# Altium project Main-PCB-v1.0.PrjPcb (part 2 of 3)

## Sheet Power-Sheet.SchDoc
size 420 x 297 mm; SheetNumber: 2; SheetTotal: 4
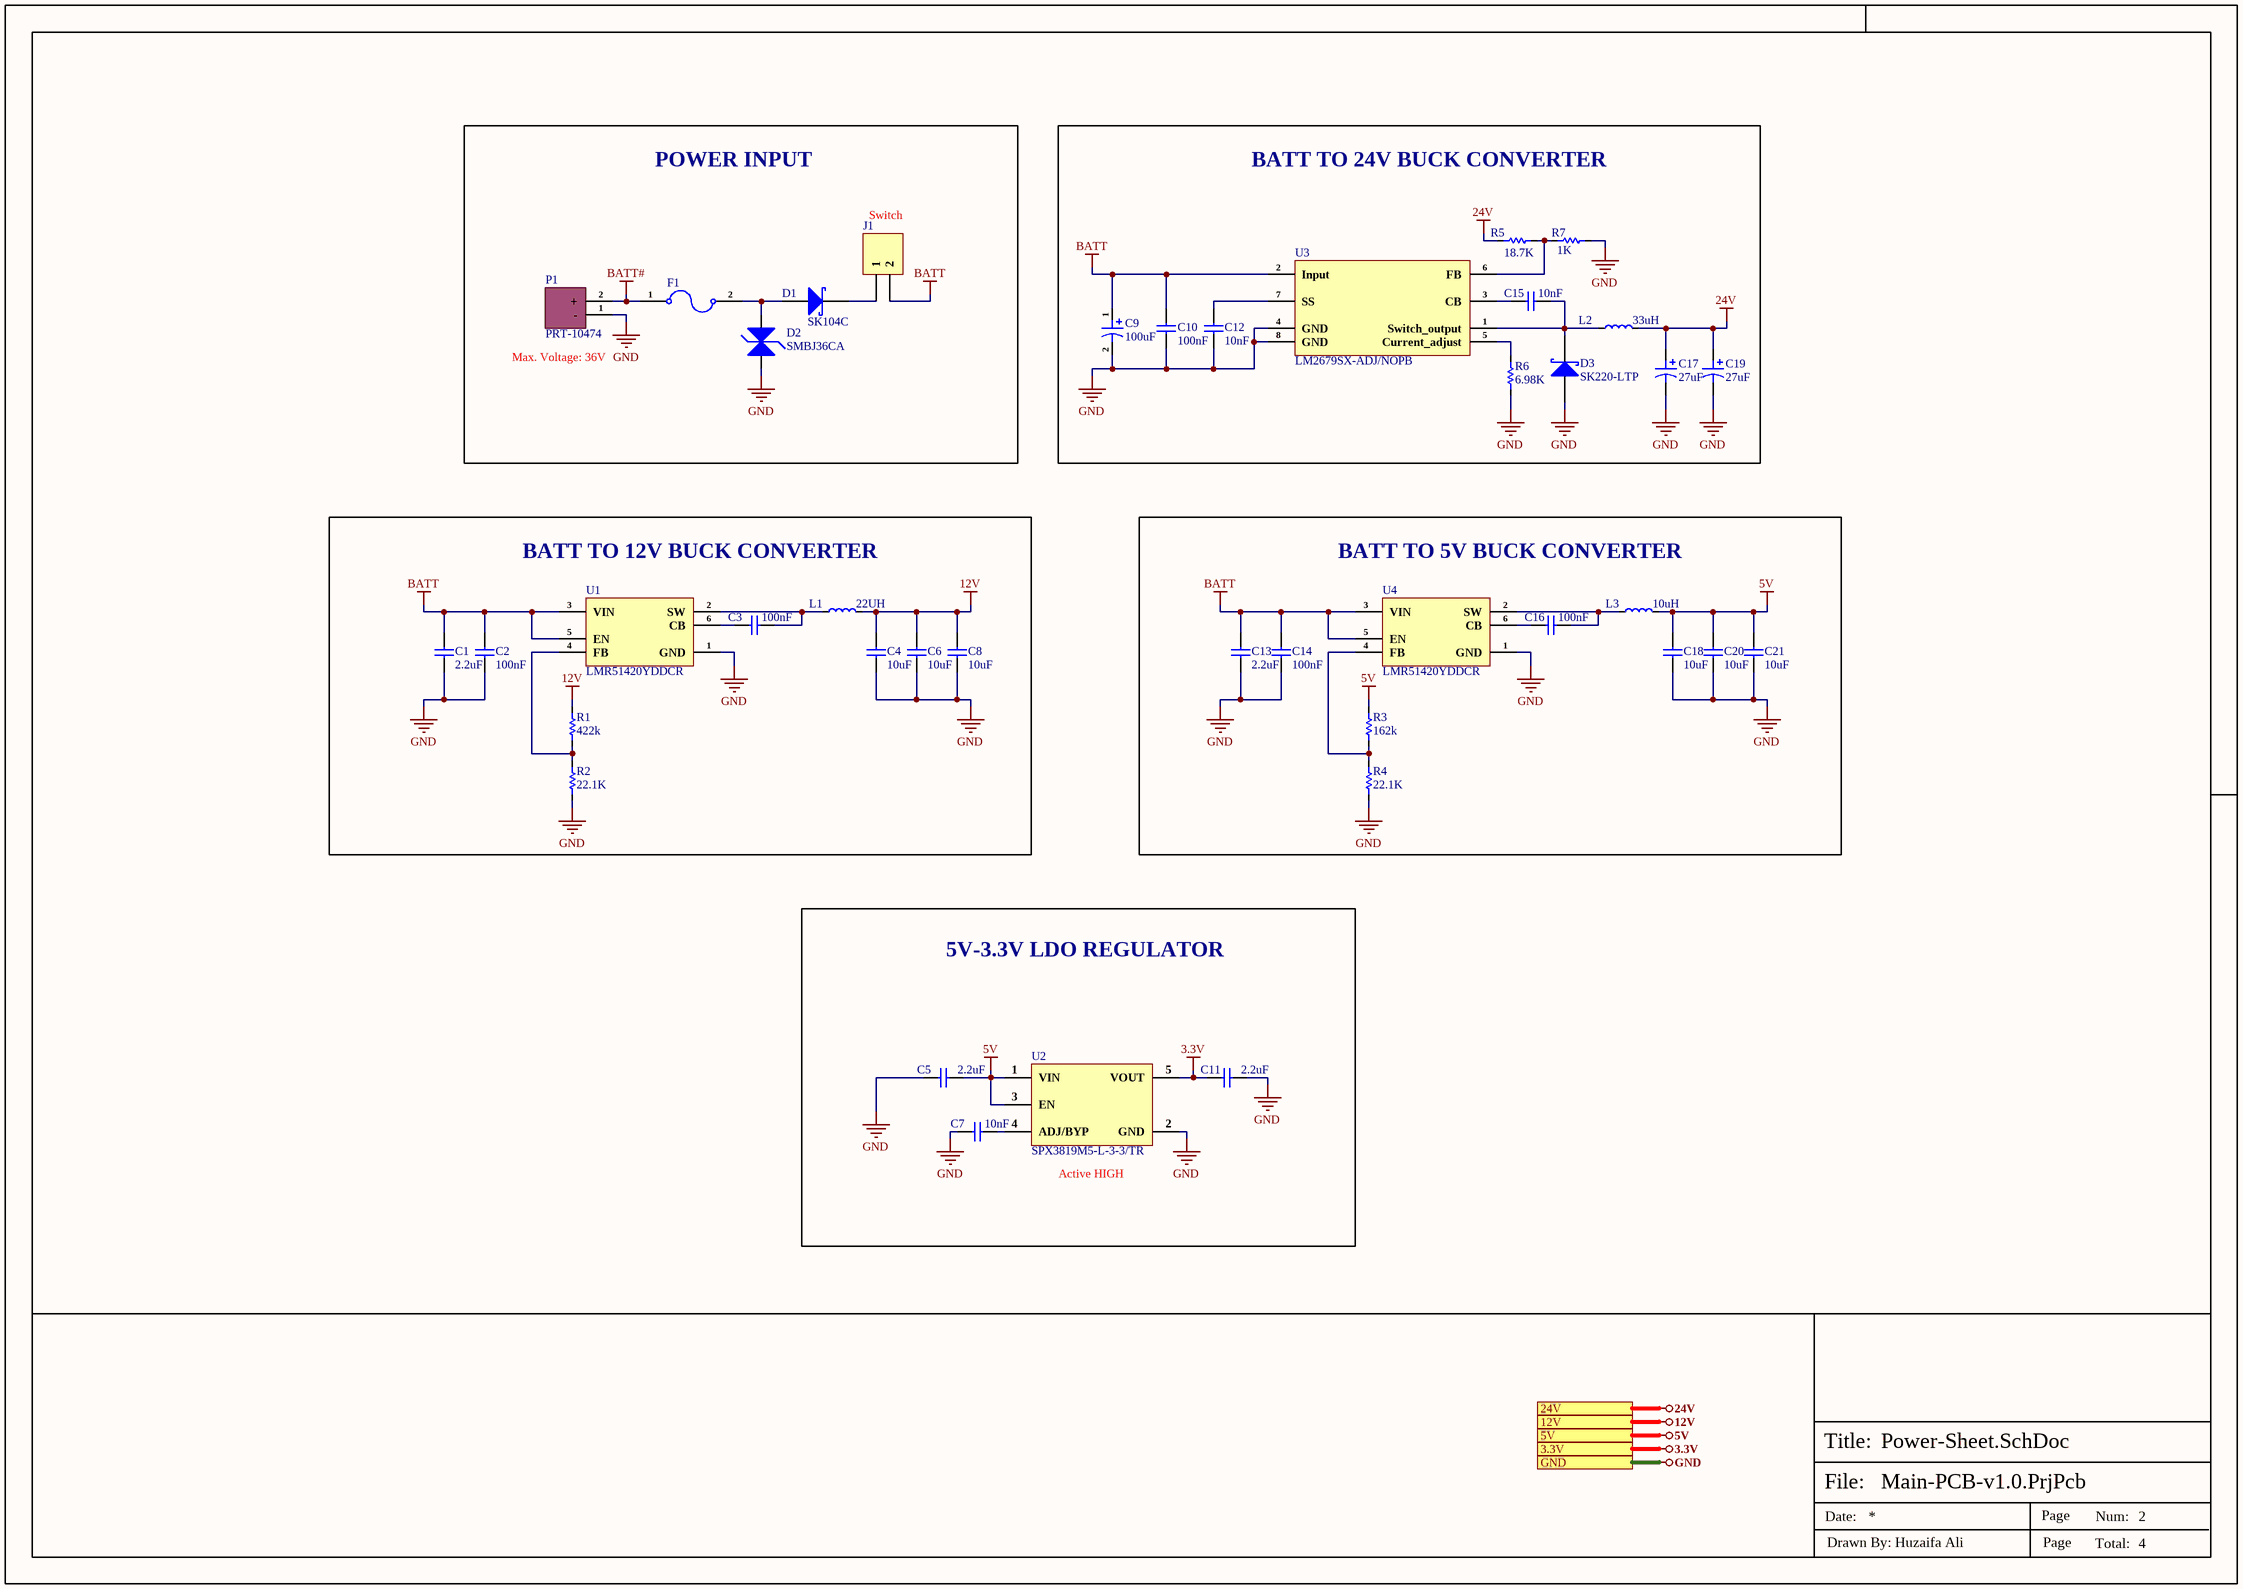
[diagram p2: Power-Sheet.SchDoc]

### Parts
C1  2.2uF  [Cap-0805]
C2  100nF  [Cap-0603]
C3  100nF  [Cap-0603]
C4  10uF  [Cap-0603]
C5  2.2uF  [CAP-0603]
C6  10uF  [Cap-0603]
C7  10nF  [Cap-0603]
C8  10uF  [Cap-0603]
C9  100uF  [UUD-100uF-8mmDia]
C10  100nF  [Cap-0603]
C11  2.2uF  [CAP-0603]
C12  10nF  [Cap-0402]
C13  2.2uF  [Cap-0805]
C14  100nF  [Cap-0603]
C15  10nF  [Cap-0402]
C16  100nF  [Cap-0603]
C17  27uF  [VUA270M1VTR-0606]
C18  10uF  [Cap-0603]
C19  27uF  [VUA270M1VTR-0606]
C20  10uF  [Cap-0603]
C21  10uF  [Cap-0603]
D1  SK104C  [SMC]
D2  SMBJ36CA  [SMB_]
D3  SK220-LTP  [SMB_]
F1  SHV2920P500-30-AA  [Fuse-2920]  (value not drawn)
J1  2P THrough Hole Pads  [2P THrough Hole Pads]  (value not drawn)
L1  22UH  [YPRH1204-220M_]
L2  33uH  [YPRH1508-330M]
L3  10uH  [SWPA8040S100MT]
P1  PRT-10474  [PRT-10474]
R1  422k  [RES-0805]
R2  22.1K  [Res-0402]
R3  162k  [Res-0402]
R4  22.1K  [Res-0402]
R5  18.7K  [Res-0402]
R6  6.98K  [Res-0402]
R7  1K  [Res-0402]
U1  LMR51420YDDCR  [SOT-23-6 THIN]
U2  SPX3819M5-L-3-3/TR  [SOT-23-5]
U3  LM2679SX-ADJ/NOPB  [TO-263-7]
U4  LMR51420YDDCR  [SOT-23-6 THIN]

### Blocks framed on the sheet
POWER INPUT: D1 D2 F1 J1 P1
BATT TO 24V BUCK CONVERTER: C9 C10 C12 C15 C17 C19 D3 L2 R5-R7 U3
BATT TO 12V BUCK CONVERTER: C1-C4 C6 C8 L1 R1 R2 U1
BATT TO 5V BUCK CONVERTER: C13 C14 C16 C18 C20 C21 L3 R3 R4 U4
5V-3.3V LDO REGULATOR: C5 C7 C11 U2

### Ports
3.3V, 5V, 12V, 24V, GND

### Nets
3.3V: C11.1 U2.5(VOUT) ; port 3.3V
5V: C5.2 C18.2 C20.2 C21.2 L3.2 R3.2 U2.1(VIN) U2.3(EN) ; port 5V
12V: C4.2 C6.2 C8.2 L1.2 R1.2 ; port 12V
24V: C17.1 C19.1 L2.2 R5.1 ; port 24V
BATT: C1.2 C2.2 C9.1 C10.2 C13.2 C14.2 J1.2 U1.3(VIN) U1.5(EN) U3.2(Input) U4.3(VIN) U4.5(EN)
BATT#: F1.1 P1.2(+)
GND: C1.1 C2.1 C4.1 C5.1 C6.1 C7.1 C8.1 C9.2 C10.1 C11.2 C12.1 C13.1 C14.1 C17.2 C18.1 C19.2 C20.1 C21.1 D2.1(A) D3.1 P1.1(-) R2.1 R4.1 R6.1 R7.1 U1.1(GND) U2.2(GND) U3.4(GND) U3.8(GND) U4.1(GND) ; port GND
NetC3_1: C3.1 L1.1 U1.2(SW)
NetC3_2: C3.2 U1.6(CB)
NetC7_2: C7.2 U2.4(ADJ/BYP)
NetC12_2: C12.2 U3.7(SS)
NetC15_1: C15.1 D3.2 L2.1 U3.1(Switch_output)
NetC15_2: C15.2 U3.3(CB)
NetC16_1: C16.1 L3.1 U4.2(SW)
NetC16_2: C16.2 U4.6(CB)
NetD1_1: D1.1 J1.1
NetD1_2: D1.2 D2.2(A) F1.2
NetR1_1: R1.1 R2.2 U1.4(FB)
NetR3_1: R3.1 R4.2 U4.4(FB)
NetR5_2: R5.2 R7.2 U3.6(FB)
NetR6_2: R6.2 U3.5(Current_adjust)

### Notes on the sheet
- Switch
- (near P1) Max. Voltage: 36V
- (near U2) Active HIGH
- File:
- Title:
- Date:
- Page
- Num:
- Total:
- Drawn By: Huzaifa Ali

### Library data of the parts
C1 C13 = CC0805KKX5R9BB225: CAP CER 2.2UF 50V X5R 0805; Manufacturer: Yageo; Tolerance: 10%; Item Type: Capacitor; Supplier 1: Mouser; Manufacturer Part Number: CC0805KKX5R9BB225; RoHS: Yes; Category: Ceramic Capacitors; Stock 1: 3880; Pricing 1: 1=0.26000, 10=0.12100, 50=0.12100, 100=0.08700, 1000=0.06700, 10000=0.05000 (USD); Mounting Technology: Surface Mount; Case/Package: 0805; Case Code (Metric): 2012; Case Code (Imperial): 0805; Weight: 0.000194oz; Min Operating Temperature: -55°C; Max Operating Temperature: 85°C; Packaging: Tape and Reel; Value: 2.2uF; Voltage Rating: 50V; Dielectric: X5R; Termination: SMD/SMT; Resistor Type: Ceramic; Voltage Rating (DC): 50V; Package Quantity: 3000; Length: 0.079inch; Width: 1.25mm; Thickness: 0.057inch; Lead Free: Lead Free; Halogen Free: Halogen Free; RoHS Compliant: Yes; ComponentLink1URL: http://www.mouser.com/ds/2/447/Yageo_UPY-GP_NP0_16V-to-50V_9-358835.pdf?src-supplier=Mouser; ComponentLink1Description: http://www.mouser.com/ds/2/447/Yageo_UPY-GP_NP0_16V-to-50V_9-358835.pdf?src-supplier=Mouser; ComponentLink2URL: http://www.yageo.com/documents/recent/UPY-GPHC_X5R_4V-to-50V_25.pdf?src-supplier=Digi-Key; ComponentLink2Description: http://www.yageo.com/documents/recent/UPY-GPHC_X5R_4V-to-50V_25.pdf?src-supplier=Digi-Key; Supplier Part Number 1: 603-CC805KKX5R9BB225; LCSC Part Number: C326581
C2 C3 C10 C14 C16 = CC0603KRX5R9BB104: CAP CER 0.1UF 50V X5R 0603; Manufacturer: Yageo; Tolerance: 10%; Item Type: Capacitor; Supplier 1: Digi-Key; Manufacturer Part Number: CC0603KRX5R9BB104; RoHS: Yes; Category: Ceramic Capacitors; Stock 1: 152253; Pricing 1: 1=0.10000, 10=0.05200, 50=0.02820, 100=0.02310, 500=0.01648, 1000=0.01294 (USD); Mount: Surface Mount; Case/Package: 0603; Case Code (Imperial): 0603; Case Code (Metric): 1608; Weight: 7.1E-05oz; Min Operating Temperature: -55°C; Max Operating Temperature: 85°C; Capacitance: 100nF; Packaging: Tape and Reel; Voltage Rating: 50V; Dielectric: X5R; Termination: SMD/SMT; Voltage Rating (DC): 50V; Package Quantity: 4000; Length: 0.063inch; Width: 0.031inch; Thickness: 0.035inch; Lead Free: Lead Free; Halogen Free: Halogen Free; ComponentLink1URL: http://www.mouser.com/ds/2/447/Yageo_UPY-GP_NP0_16V-to-50V_9-358835.pdf?src-supplier=Mouser; ComponentLink1Description: http://www.mouser.com/ds/2/447/Yageo_UPY-GP_NP0_16V-to-50V_9-358835.pdf?src-supplier=Mouser; ComponentLink2URL: https://www.yageo.com/upload/media/product/productsearch/datasheet/mlcc/UPY-GPHC_X5R_4V-to-50V_26.pdf?src-supplier=Digi-Key; ComponentLink2Description: https://www.yageo.com/upload/media/product/productsearch/datasheet/mlcc/UPY-GPHC_X5R_4V-to-50V_26.pdf?src-supplier=Digi-Key; ComponentLink3URL: http://www.yageo.com/exep/pages/download/literatures/ProductSelectionGuide%202014_Final_2.pdf?src-supplier=Digi-Key; ComponentLink3Description: http://www.yageo.com/exep/pages/download/literatures/ProductSelectionGuide%202014_Final_2.pdf?src-supplier=Digi-Key; Supplier Part Number 1: 311-4046-1-ND; LCSC Part Number: C110022
C4 C6 C8 C18 C20 C21 = CC0603KRX5R6BB106: CAP CER 10UF 10V X5R 0603; Manufacturer: Yageo; Tolerance: 10%; Item Type: Capacitor; Supplier 1: Digi-Key; Manufacturer Part Number: CC0603KRX5R6BB106; RoHS: Yes; Category: Ceramic Capacitors; Stock 1: 187515; Pricing 1: 1=0.24000, 10=0.16300, 50=0.09780, 100=0.08260, 500=0.05654, 1000=0.05001 (USD); Mount: Surface Mount; Case/Package: 0603; Case Code (Metric): 1608; Case Code (Imperial): 0603; Weight: 7.1E-05oz; Min Operating Temperature: -55°C; Max Operating Temperature: 85°C; Capacitance: 10uF; Packaging: Tape and Reel; Dielectric: X5R; Voltage Rating: 10V; Termination: SMD/SMT; Resistor Type: Ceramic; Voltage Rating (DC): 10V; Package Quantity: 4000; Length: 0.063inch; Width: 0.031inch; Thickness: 0.035inch; Depth: 0.8mm; Lead Free: Lead Free; Halogen Free: Halogen Free; RoHS Compliant: Yes; ComponentLink1URL: http://www.mouser.com/ds/2/447/Yageo_UPY-GP_NP0_16V-to-50V_9-358835.pdf?src-supplier=Mouser; ComponentLink1Description: http://www.mouser.com/ds/2/447/Yageo_UPY-GP_NP0_16V-to-50V_9-358835.pdf?src-supplier=Mouser; ComponentLink2URL: http://www.yageo.com/documents/recent/UPY-GPHC_X5R_4V-to-50V_25.pdf?src-supplier=Digi-Key; ComponentLink2Description: http://www.yageo.com/documents/recent/UPY-GPHC_X5R_4V-to-50V_25.pdf?src-supplier=Digi-Key; Supplier Part Number 1: 311-1782-1-ND; LCSC Part Number: C326057
C5 C11 = CC0603KRX5R8BB225: CAP CER 2.2UF 25V X5R 0603; Manufacturer: Yageo; Tolerance: 10%; Supplier 1: Digi-Key; Manufacturer Part Number: CC0603KRX5R8BB225; Stock 1: 687936; Pricing 1: 1=0.4, 10=0.276, 50=0.1932, 100=0.1656, 500=0.1242, 1000=0.10488 (USD); Mount: Surface Mount; Case/Package: 0603; Case Code (Metric): 1608; Case Code (Imperial): 0603; Weight: 7.1E-05oz; Min Operating Temperature: -55°C; Max Operating Temperature: 85°C; Packaging: Tape and Reel; Capacitance: 2.2uF; Dielectric: X5R; Voltage Rating: 25V; Termination: SMD/SMT; Resistor Type: Ceramic; Voltage Rating (DC): 25V; Package Quantity: 4000; Length: 1.6mm; Width: 0.031inch; Thickness: 0.037inch; Depth: 0.8mm; Radiation Hardening: No; Lead Free: Lead Free; Halogen Free: Halogen Free; RoHS Compliant: Yes; ComponentLink1URL: https://www.verical.com/server-webapp/html/getDatasheet?partID=782757&src-supplier=Verical; ComponentLink1Description: https://www.verical.com/server-webapp/html/getDatasheet?partID=782757&src-supplier=Verical; Supplier Part Number 1: 311-1786-1-ND; LCSC Part Number: C309478
C7 = CC0603JRNPO9BN103: CAP CER 10000PF 50V C0G/NPO 0603; Manufacturer: Yageo; Tolerance: 5%; Item Type: Capacitor; Supplier 1: Arrow Electronics; Manufacturer Part Number: CC0603JRNPO9BN103; RoHS: Yes; Category: Ceramic Capacitors; Stock 1: 5425; Pricing 1: 1=0.42340, 10=0.29770, 25=0.25590, 100=0.19550, 250=0.19360, 500=0.14320, 1000=0.12060, 3000=0.11930 (USD); Mount: Surface Mount; Case/Package: 0603; Min Operating Temperature: -55°C; Max Operating Temperature: 125°C; Packaging: Tape and Reel; Capacitance: 10nF; Voltage Rating: 50V; Length: 0.063inch; Width: 0.031inch; Thickness: 0.035inch; RoHS Compliant: Yes; ComponentLink1URL: http://www.yageo.com/documents/recent/UPY-GP_NP0_16V-to-50V_16.pdf?src-supplier=Digi-Key; ComponentLink1Description: http://www.yageo.com/documents/recent/UPY-GP_NP0_16V-to-50V_16.pdf?src-supplier=Digi-Key; ComponentLink2URL: http://www.yageo.com/exep/pages/download/literatures/ProductSelectionGuide%202014_Final_2.pdf?src-supplier=Digi-Key; ComponentLink2Description: http://www.yageo.com/exep/pages/download/literatures/ProductSelectionGuide%202014_Final_2.pdf?src-supplier=Digi-Key; Supplier Part Number 1: CC0603JRNPO9BN103; LCSC Part Number: C389113
C9 = UUD1H101MNL1GS: CAP ALUM 100UF 20% 50V SMD; Manufacturer: Nichicon; Dielectric Material: Aluminium; Ripple Current: 300mA; Life (Hours): 5000Hour; Impedance: 340mR; Leakage Current: 3uA; Dissipation Factor: 0.14%; Lead Diameter: 1.1mm; Item Type: Capacitor; Supplier 1: Digi-Key; Manufacturer Part Number: UUD1H101MNL1GS; RoHS: Yes; Category: Aluminum Electrolytic Capacitors; Pricing 1: 1=0.62000, 10=0.44000, 50=0.33300, 100=0.29000 (USD); Case/Package: Radial; Number of Pins: 2; Min Operating Temperature: -55°C; Max Operating Temperature: 105°C; Tolerance: 20%; Capacitance: 100uF; Ripple Current (AC): 300mA; Voltage Rating (DC): 50V; Package Quantity: 500; Packaging: Tape and Reel; Voltage Rating: 50V; Termination: SMD/SMT; Voltage: 50V; Series: UD; Construction: Cylindrical; Diameter: 8mm; Length: 10mm; Height: 10mm; Lead Pitch: 3.1mm; Height - Seated (Max): 0.394inch; Radiation Hardening: No; REACH SVHC: No SVHC; Lead Free: Lead Free; RoHS Compliant: Yes; ComponentLink1URL: https://datasheet.ciiva.com/6002/66055-6002224.pdf?src-supplier=Farnell; ComponentLink1Description: https://datasheet.ciiva.com/6002/66055-6002224.pdf?src-supplier=Farnell; ComponentLink2URL: https://datasheet.ciiva.com/11781/0900766b80fa39e7-11781901.pdf?src-supplier=RSComponents; ComponentLink2Description: https://datasheet.ciiva.com/11781/0900766b80fa39e7-11781901.pdf?src-supplier=RSComponents; ComponentLink3URL: https://datasheet.ciiva.com/97/e-ud-97939.pdf?src-supplier=Digi-Key; ComponentLink3Description: https://datasheet.ciiva.com/97/e-ud-97939.pdf?src-supplier=Digi-Key; ComponentLink4URL: https://datasheet.ciiva.com/97/e-ud-97940.pdf?src-supplier=Digi-Key; ComponentLink4Description: https://datasheet.ciiva.com/97/e-ud-97940.pdf?src-supplier=Digi-Key; ComponentLink5URL: https://datasheet.ciiva.com/97/e-ud-97941.pdf?src-supplier=Digi-Key; ComponentLink5Description: https://datasheet.ciiva.com/97/e-ud-97941.pdf?src-supplier=Digi-Key; ComponentLink6URL: https://datasheet.ciiva.com/28458/e-ud-28458117.pdf?src-supplier=Element14; ComponentLink6Description: https://datasheet.ciiva.com/28458/e-ud-28458117.pdf?src-supplier=Element14; ComponentLink7URL: https://datasheet.ciiva.com/28458/1910936-28458133.pdf?src-supplier=Element14; ComponentLink7Description: https://datasheet.ciiva.com/28458/1910936-28458133.pdf?src-supplier=Element14; ComponentLink8URL: https://datasheet.ciiva.com/5362/e-ud-5362134.pdf?src-supplier=Mouser; ComponentLink8Description: https://datasheet.ciiva.com/5362/e-ud-5362134.pdf?src-supplier=Mouser; ComponentLink9URL: https://datasheet.ciiva.com/7781/66055-7781450.pdf?src-supplier=Element14; ComponentLink9Description: https://datasheet.ciiva.com/7781/66055-7781450.pdf?src-supplier=Element14; ComponentLink10URL: https://datasheet.ciiva.com/17354/e-ud-17354671.pdf?src-supplier=Avnet+Europe; ComponentLink10Description: https://datasheet.ciiva.com/17354/e-ud-17354671.pdf?src-supplier=Avnet+Europe; Supplier Part Number 1: 493-2306-6-ND; LCSC Part Number: C116241
C12 C15 = CC0402KRX7R9BB103: CAP CER 10000PF 50V X7R 0402; Manufacturer: Yageo; Tolerance: 10%; Item Type: Capacitor; Supplier 1: Avnet; Manufacturer Part Number: CC0402KRX7R9BB103; RoHS: Yes; Category: Ceramic Capacitors; Stock 1: 995000; Pricing 1: 10000=0.00178 (USD); Mount: Surface Mount; Case/Package: 0402; Case Code (Imperial): 0402; Case Code (Metric): 1005; Min Operating Temperature: -55°C; Max Operating Temperature: 125°C; Capacitance: 10nF; Dielectric: X7R; Packaging: Tape and Reel; Voltage Rating: 50V; Voltage Rating (DC): 50V; Package Quantity: 1; Termination: SMD/SMT; Resistor Type: Ceramic; Voltage: 50V; Series: CC; Length: 1mm; Width: 0.02inch; Height: 0.5mm; Thickness: 0.022inch; Depth: 0.5mm; Radiation Hardening: No; RoHS Compliant: Yes; Reach SVHC Compliant: Yes; Lead Free: Lead Free; Halogen Free: Halogen Free; ComponentLink1URL: https://datasheet.ciiva.com/11788/0900766b8079c870-11788375.pdf?src-supplier=RSComponents; ComponentLink1Description: https://datasheet.ciiva.com/11788/0900766b8079c870-11788375.pdf?src-supplier=RSComponents; ComponentLink2URL: https://datasheet.ciiva.com/26862/getdatasheetpartid-138248-26862642.pdf?src-supplier=Verical; ComponentLink2Description: https://datasheet.ciiva.com/26862/getdatasheetpartid-138248-26862642.pdf?src-supplier=Verical; ComponentLink3URL: https://datasheet.ciiva.com/7978/1489800-7978093.pdf?src-supplier=Element14; ComponentLink3Description: https://datasheet.ciiva.com/7978/1489800-7978093.pdf?src-supplier=Element14; ComponentLink4URL: https://datasheet.ciiva.com/28450/1489800-28450377.pdf?src-supplier=Element14; ComponentLink4Description: https://datasheet.ciiva.com/28450/1489800-28450377.pdf?src-supplier=Element14; ComponentLink5URL: https://datasheet.ciiva.com/176/mlccorderingcode-176349.pdf?src-supplier=Digi-Key; ComponentLink5Description: https://datasheet.ciiva.com/176/mlccorderingcode-176349.pdf?src-supplier=Digi-Key; ComponentLink6URL: https://datasheet.ciiva.com/176/mlccorderingcode-176348.pdf?src-supplier=Digi-Key; ComponentLink6Description: https://datasheet.ciiva.com/176/mlccorderingcode-176348.pdf?src-supplier=Digi-Key; ComponentLink7URL: https://datasheet.ciiva.com/176/mlccorderingcode-176350.pdf?src-supplier=Digi-Key; ComponentLink7Description: https://datasheet.ciiva.com/176/mlccorderingcode-176350.pdf?src-supplier=Digi-Key; Supplier Part Number 1: CC0402KRX7R9BB103; LCSC Part Number: C60133
C17 C19 = VUA270M1VTR-0606: 27uF 35V ±20% SMD,D6.3xL5.7mm Aluminum Electrolytic Capacitors - SMD ROHS; Manufacturer: Lelon; Manufacturer Part Number: VUA270M1VTR-0606; Package: SMD,D6.3xL5.7mm; LCSC Part Number: C249807; Item Type: Capacitor; ComponentLink1Description: LCSC; ComponentLink1URL: https://www.lcsc.com/product-detail/Aluminum-Electrolytic-Capacitors-SMD_Lelon-VUA270M1VTR-0606_C249807.html
D1 = SK104C: 40V 650mV@10A 10A SMC(DO-214AB) Schottky Barrier Diodes (SBD) ROHS; Manufacturer: MDD; Item Type: Diode; Manufacturer Part Number: SK104C; Package: SMC(DO-214AB); LCSC Part Number: C59500; ComponentLink1Description: LCSC; ComponentLink1URL: https://www.lcsc.com/product-detail/Schottky-Barrier-Diodes-SBD_MDD-Microdiode-Electronics-SK104C_C59500.html
D2 = SMBJ36CA: 58.1V 40V 36V Bi-Directional SMB(DO-214AA) TVS ROHS; Manufacturer: Slkor(SLKORMICRO Elec.); Item Type: Diode; Manufacturer Part Number: SMBJ36CA; Package: SMB(DO-214AA); LCSC Part Number: C556189; ComponentLink1Description: LCSC; ComponentLink1URL: https://www.lcsc.com/product-detail/span-style-background-color-ff0-TVS-span_Slkor-SLKORMICRO-Elec-SMBJ36CA_C556189.html
D3 = SK220-LTP: 200V 900mV@2A 2A SMB(DO-214AA) Schottky Barrier Diodes (SBD) ROHS; Manufacturer: MCC; Item Type: Diode; Supplier 1: Mouser; Manufacturer Part Number: SK220-LTP; RoHS: Yes; Category: Rectifier Diodes; Stock 1: 5871; Pricing 1: 1=0.47, 10=0.364, 50=0.364, 100=0.227, 1000=0.12, 10000=0.092 (USD); Mounting Technology: Surface Mount; Package Quantity: 3000; Packaging: Tape and Reel; Average Rectified Current: 2A; Max Reverse Voltage (DC): 200V; Series: -; Lead Free: Lead Free; RoHS Compliant: Yes; ComponentLink1URL: https://datasheet.ciiva.com/6377/sk22-lsk220-ldo-214aa-6377942.pdf?src-supplier=Digi-Key; ComponentLink1Description: https://datasheet.ciiva.com/6377/sk22-lsk220-ldo-214aa-6377942.pdf?src-supplier=Digi-Key; Supplier Part Number 1: 833-SK220-LTP; LCSC Part Number: C725397
F1 = SHV2920P500-30-AA: 30V 5A 5A 2920 Resettable Fuses ROHS; Manufacturer: PTTC(Polytronics Tech); Item Type: Fuse; ComponentLink1Description: LCSC; ComponentLink1URL: https://www.lcsc.com/product-detail/Resettable-Fuses_PTTC-Polytronics-Tech-SHV2920P500-30-AA_C495350.html; Manufacturer Part Number: SHV2920P500-30-AA; Package: 2920; LCSC Part Number: C495350
J1 = 2P THrough Hole Pads: Wire Connecting Pad; Manufacturer Part Number: 2P THrough Hole Pads; Item Type: THrough Hole Pads
L1 = YPRH1204-220M: 2.9A 22uH ±20% 66mΩ SMD,12x12x5mm Power Inductors ROHS; Manufacturer: YJYCOIN; Manufacturer Part Number: YPRH1204-220M; Package: SMD,12x12x5mm; LCSC Part Number: C338845; Item Type: Inductor; ComponentLink1Description: LCSC; ComponentLink1URL: https://www.lcsc.com/product-detail/Power-Inductors_YJYCOIN-YPRH1204-220M_C338845.html
L2 = YPRH1508-330M: 6A 33uH ±20% SMD,15x15x8mm Power Inductors ROHS; Manufacturer: YJYCOIN; ComponentLink1Description: LCSC; ComponentLink1URL: https://www.lcsc.com/product-detail/Power-Inductors_YJYCOIN-YPRH1508-330M_C970542.html; Manufacturer Part Number: YPRH1508-330M; Package: SMD,15x15x8mm; LCSC Part Number: C970542; Item Type: Inductor
L3 = SWPA8040S100MT: Fixed Ind 1020%UH 0.029 Ohm 4100M; Manufacturer: Sunlord; Item Type: Inductor; Supplier 1: Digi-Key; Manufacturer Part Number: SWPA8040S100MT; RoHS: Yes; Category: Fixed Inductors; Stock 1: 2032; Pricing 1: 1=1.24, 10=1.149, 25=1.0604, 50=0.8838, 100=0.8307, 250=0.74236, 500=0.6363 (USD); RoHS Compliant: Yes; Supplier Part Number 1: 3442-SWPA8040S100MTCT-ND; LCSC Part Number: C37429; ComponentLink1Description: LCSC; ComponentLink1URL: https://www.lcsc.com/product-detail/Power-Inductors_Sunlord-SWPA8040S100MT_C37429.html
P1 = PRT-10474: XT60 CONNECTORS MALE/FEMALE PAIR; Manufacturer: SparkFun; Supplier 1: Digi-Key; Manufacturer Part Number: PRT-10474; RoHS: No; Stock 1: 3234; Pricing 1: 1=1.50000 (USD); ComponentLink1URL: https://cdn.sparkfun.com/datasheets/Prototyping/xt60.pdf?src-supplier=Digi-Key; ComponentLink1Description: https://cdn.sparkfun.com/datasheets/Prototyping/xt60.pdf?src-supplier=Digi-Key; Supplier Part Number 1: 1568-1816-ND
R1 = RT0805BRD07422KL: RES SMD 422K OHM 0.1% 1/8W 0805; Manufacturer: Yageo; Voltage Rating: 150V; Value: 422kR; Power Rating: 125mW; Temperature Coefficient: 25ppm/°C; Item Type: Resistor; Supplier 1: Digi-Key; Manufacturer Part Number: RT0805BRD07422KL; RoHS: Yes; Category: Chip SMD Resistors; Stock 1: 2917; Pricing 1: 1=0.38, 10=0.272, 100=0.1087, 500=0.07404, 1000=0.05357, 2500=0.04963 (USD); Case/Package: 0805; Case Code (Metric): 2012; Case Code (Imperial): 0805; Min Operating Temperature: -55°C; Max Operating Temperature: 155°C; Tolerance: 0.1%; Packaging: Tape and Reel; Termination: SMD/SMT; Voltage Rating (DC): 150V; Series: RT; Max Power Dissipation: 125mW; Number of Terminations: 2; Length: 2mm; Width: 1.25mm; Height: 500um; Lead Free: Lead Free; RoHS Compliant: Yes; ComponentLink1URL: https://datasheet.ciiva.com/12704/pyu-rt-1-to-0-05-rohs-l-4-12704463.pdf?src-supplier=Mouser; ComponentLink1Description: https://datasheet.ciiva.com/12704/pyu-rt-1-to-0-05-rohs-l-4-12704463.pdf?src-supplier=Mouser; Supplier Part Number 1: YAG4899CT-ND; LCSC Part Number: C865483
R2 R4 = RT0402BRD0722K1L: RES SMD 22.1KOHM 0.1% 1/16W 0402; Manufacturer: Yageo; Value: 22.1kR; Power Rating: 62.5mW; Voltage Rating: 50V; Max Power Dissipation: 63mW; Temperature Coefficient: 25ppm/°C; Item Type: Resistor; Supplier 1: Arrow Electronics; Manufacturer Part Number: RT0402BRD0722K1L; RoHS: Yes; Category: Chip SMD Resistors; Stock 1: 40000; Pricing 1: 10000=0.0417, 20000=0.0733, 30000=0.041, 40000=0.0719, 50000=0.0402, 100000=0.0393 (USD); Case/Package: 0402; Case Code (Metric): 1005; Case Code (Imperial): 0402; Weight: 2.3E-05oz; Min Operating Temperature: -55°C; Max Operating Temperature: 155°C; Tolerance: 0.1%; Packaging: Tape and Reel; Package Quantity: 10000; Number of Terminations: 2; Termination: SMD/SMT; Voltage Rating (DC): 50V; Series: RT; Length: 0.039inch; Width: 0.5mm; Height: 0.014inch; Lead Free: Lead Free; RoHS Compliant: Yes; ComponentLink1URL: https://datasheet.ciiva.com/2582/pyu-rt-1-to-0-05-rohs-l-5-2582235.pdf?src-supplier=Digi-Key; ComponentLink1Description: https://datasheet.ciiva.com/2582/pyu-rt-1-to-0-05-rohs-l-5-2582235.pdf?src-supplier=Digi-Key; ComponentLink2URL: https://datasheet.ciiva.com/12797/pyu-rt-1-to-0-05-rohs-l-4-12797086.pdf?src-supplier=Mouser; ComponentLink2Description: https://datasheet.ciiva.com/12797/pyu-rt-1-to-0-05-rohs-l-4-12797086.pdf?src-supplier=Mouser; Supplier Part Number 1: RT0402BRD0722K1L; LCSC Part Number: C852648
R3 = RT0402BRD07162KL: RES SMD 162K OHM 0.1% 1/16W 0402; Manufacturer: Yageo; Value: 162kR; Max Power Dissipation: 63mW; Temperature Coefficient: 25ppm/°C; Item Type: Resistor; Supplier 1: Future Electronics; Manufacturer Part Number: RT0402BRD07162KL; RoHS: Yes; Category: Chip SMD Resistors; Stock 1: 20000; Pricing 1: 10000=0.0218, 20000=0.0213, 30000=0.021, 50000=0.0206, 100000=0.0199 (USD); Case/Package: 0402; Min Operating Temperature: -55°C; Max Operating Temperature: 155°C; Packaging: Tape and Reel; Number of Terminations: 2; Tolerance: 0.1%; Features: Moisture Resistant; Series: RT; Length: 0.039inch; Width: 0.02inch; Height: 0.014inch; RoHS Compliant: Yes; ComponentLink1URL: http://www.yageo.com/documents/recent/PYu-RT_1-to-0.01_RoHS_L_8.pdf?src-supplier=Digi-Key; ComponentLink1Description: http://www.yageo.com/documents/recent/PYu-RT_1-to-0.01_RoHS_L_8.pdf?src-supplier=Digi-Key; Supplier Part Number 1: 3159372; LCSC Part Number: C852551
R5 = RT0402BRD0718K7L: RES SMD 18.7KOHM 0.1% 1/16W 0402; Manufacturer: Yageo; Value: 18.7kR; Power Rating: 62.5mW; Voltage Rating: 50V; Max Power Dissipation: 63mW; Temperature Coefficient: 25ppm/°C; Item Type: Resistor; Supplier 1: Digi-Key; Manufacturer Part Number: RT0402BRD0718K7L; RoHS: Yes; Category: Chip SMD Resistors; Stock 1: 10714; Pricing 1: 1=0.4, 10=0.336, 100=0.1313, 500=0.07938, 1000=0.05496, 2500=0.05038, 5000=0.0458 (USD); Case/Package: 0402; Case Code (Metric): 1005; Case Code (Imperial): 0402; Min Operating Temperature: -55°C; Max Operating Temperature: 155°C; Package Quantity: 10000; Packaging: Tape and Reel; Tolerance: 0.1%; Number of Terminations: 2; Termination: SMD/SMT; Voltage Rating (DC): 50V; Series: RT; Length: 0.039inch; Width: 0.02inch; Height: 0.014inch; Lead Free: Lead Free; RoHS Compliant: Yes; ComponentLink1URL: https://datasheet.ciiva.com/2582/pyu-rt-1-to-0-05-rohs-l-4-2582177.pdf?src-supplier=Digi-Key; ComponentLink1Description: https://datasheet.ciiva.com/2582/pyu-rt-1-to-0-05-rohs-l-4-2582177.pdf?src-supplier=Digi-Key; ComponentLink2URL: https://datasheet.ciiva.com/12725/pyu-rt-1-to-0-05-rohs-l-4-12725319.pdf?src-supplier=Mouser; ComponentLink2Description: https://datasheet.ciiva.com/12725/pyu-rt-1-to-0-05-rohs-l-4-12725319.pdf?src-supplier=Mouser; ComponentLink3URL: https://datasheet.ciiva.com/46635/pyu-rt-1-to-0-05-rohs-l-5-46635183.pdf?src-supplier=Digi-Key; ComponentLink3Description: https://datasheet.ciiva.com/46635/pyu-rt-1-to-0-05-rohs-l-5-46635183.pdf?src-supplier=Digi-Key; Supplier Part Number 1: YAG1366CT-ND; LCSC Part Number: C723581
R6 = RT0402BRD076K98L: RES SMD 6.98KOHM 0.1% 1/16W 0402; Manufacturer: Yageo; Value: 6.98kR; Power Rating: 62.5mW; Voltage Rating: 50V; Temperature Coefficient: 25ppm/°C; Max Power Dissipation: 63mW; Item Type: Resistor; Supplier 1: Future Electronics; Manufacturer Part Number: RT0402BRD076K98L; RoHS: Yes; Category: Chip SMD Resistors; Stock 1: 9500; Pricing 1: 1=0.173, 20=0.129, 150=0.0997, 1000=0.0719, 5000=0.0482 (USD); Case/Package: 0402; Case Code (Imperial): 0402; Case Code (Metric): 1005; Weight: 2.3E-05oz; Min Operating Temperature: -55°C; Max Operating Temperature: 155°C; Packaging: Tape and Reel; Tolerance: 0.1%; Package Quantity: 10000; Termination: SMD/SMT; Number of Terminations: 2; Voltage Rating (DC): 50V; Series: RT; Length: 0.039inch; Width: 0.5mm; Height: 0.014inch; Lead Free: Lead Free; RoHS Compliant: Yes; ComponentLink1URL: https://datasheet.ciiva.com/2582/pyu-rt-1-to-0-05-rohs-l-4-2582483.pdf?src-supplier=Digi-Key; ComponentLink1Description: https://datasheet.ciiva.com/2582/pyu-rt-1-to-0-05-rohs-l-4-2582483.pdf?src-supplier=Digi-Key; ComponentLink2URL: https://datasheet.ciiva.com/46635/pyu-rt-1-to-0-05-rohs-l-5-46635214.pdf?src-supplier=Digi-Key; ComponentLink2Description: https://datasheet.ciiva.com/46635/pyu-rt-1-to-0-05-rohs-l-5-46635214.pdf?src-supplier=Digi-Key; Supplier Part Number 1: 2098961; LCSC Part Number: C852901
R7 = RC0402FR-071KL: RES 1K OHM 1% 1/16W 0402; Manufacturer: Yageo; Resistance: 1kR; Temperature Coefficient: 100ppm/°C; Voltage Rating (DC): 50V; Power Rating: 62.5mW; Max Power Dissipation: 63mW; Item Type: Resistor; Supplier 1: Avnet; Manufacturer Part Number: RC0402FR-071KL; RoHS: Yes; Category: Chip SMD Resistors; Stock 1: 13030000; Pricing 1: 10000=0.00085, 20000=0.00087, 40000=0.00084, 60000=0.00083, 80000=0.00079, 100000=0.00078, 1000000=0.00076 (USD); Case/Package: 0402; Number of Pins: 2; Case Code (Imperial): 0402; Case Code (Metric): 1005; Size Code: 0402; Min Operating Temperature: -55°C; Max Operating Temperature: 155°C; Resistor Type: Thick Film; Tolerance: 1%; Packaging: Tape and Reel; Voltage Rating: 50V; Termination: SMD/SMT; Features: Moisture Resistant; Series: RC; Number of Terminations: 2; Resistance Tolerance: 1%; Construction: Rectangular; Technology: THICK FILM; Length: 1mm; Width: 0.5mm; Height: 0.32mm; Depth: 0.5mm; Reach SVHC Compliant: Yes; Lead Free: Lead Free; RoHS Compliant: Yes; Military Standard: Not; ComponentLink1URL: https://datasheet.ciiva.com/11819/0900766b80c66297-11819477.pdf?src-supplier=RSComponents; ComponentLink1Description: https://datasheet.ciiva.com/11819/0900766b80c66297-11819477.pdf?src-supplier=RSComponents; ComponentLink2URL: https://datasheet.ciiva.com/7983/1018594-7983502.pdf?src-supplier=Element14; ComponentLink2Description: https://datasheet.ciiva.com/7983/1018594-7983502.pdf?src-supplier=Element14; ComponentLink3URL: https://datasheet.ciiva.com/22747/1018594-22747513.pdf?src-supplier=Element14; ComponentLink3Description: https://datasheet.ciiva.com/22747/1018594-22747513.pdf?src-supplier=Element14; ComponentLink4URL: https://datasheet.ciiva.com/12666/pyu-rc0402-51-rohs-l-6-r-12666741.pdf?src-supplier=Mouser; ComponentLink4Description: https://datasheet.ciiva.com/12666/pyu-rc0402-51-rohs-l-6-r-12666741.pdf?src-supplier=Mouser; ComponentLink5URL: https://datasheet.ciiva.com/7849/1018594-7849869.pdf?src-supplier=Element14; ComponentLink5Description: https://datasheet.ciiva.com/7849/1018594-7849869.pdf?src-supplier=Element14; ComponentLink6URL: https://datasheet.ciiva.com/7849/1018594-7849871.pdf?src-supplier=Element14; ComponentLink6Description: https://datasheet.ciiva.com/7849/1018594-7849871.pdf?src-supplier=Element14; ComponentLink7URL: https://datasheet.ciiva.com/17063/pyu-rc0402-51-rohs-l-6-r-17063193.pdf?src-supplier=Future+Electronics; ComponentLink7Description: https://datasheet.ciiva.com/17063/pyu-rc0402-51-rohs-l-6-r-17063193.pdf?src-supplier=Future+Electronics; Supplier Part Number 1: RC0402FR-071KL; LCSC Part Number: C106235
U1 U4 = LMR51420YDDCR: IC REG BUCK ADJ 2A SOT23-THIN; Manufacturer: Texas Instruments; Supplier 1: Mouser; Manufacturer Part Number: LMR51420YDDCR; RoHS: No; Category: Integrated Circuits (ICs); Stock 1: 6752; Pricing 1: 1=1.56, 10=1.41, 50=1.33, 100=1.13, 1000=0.77, 10000=0.769 (USD); LCSC Part Number: C5383002; Item Type: IC; Supplier Part Number 1: 595-LMR51420YDDCR; ComponentLink1Description: LCSC; ComponentLink1URL: https://www.lcsc.com/product-detail/DC-DC-Converters_Texas-Instruments-LMR51420YDDCR_C5383002.html
U2 = SPX3819M5-L-3-3/TR: SPX3819 Series 3.3 V 500 mA Fixed Output SMT LDO Regulator - SOT-23-5; Manufacturer: MaxLinear; Item Type: IC; Supplier 1: Newark; Manufacturer Part Number: SPX3819M5-L-3-3/TR; RoHS: Yes; Category: Voltage Regulators - Linear; RoHS Compliant: Yes; Supplier Part Number 1: 23R9703; LCSC Part Number: C9055; ComponentLink1Description: LCSC; ComponentLink1URL: https://www.lcsc.com/product-detail/Linear-Voltage-Regulators-LDO_MaxLinear-SPX3819M5-L-3-3-TR_C9055.html
U3 = LM2679SX-ADJ/NOPB: IC REG BUCK ADJ 5A TO263-7; Manufacturer: TI National Semiconductor; Min Input Voltage: 8V; Number of Outputs: 1; Output Voltage: 37V; Efficiency: 84%; Max Supply Voltage: 40V; Switching Frequency: 260kHz; Quiescent Current: 4.2mA; Output Type: Adjustable; Synchronous Rectifier: No; Supplier 1: Mouser; Manufacturer Part Number: LM2679SX-ADJ/NOPB; RoHS: Yes; Category: Voltage Regulators - Switching; Stock 1: 3995; Pricing 1: 1=6.97, 10=6.26, 50=5.92, 100=5.13, 1000=3.72, 10000=3.72 (USD); Mounting Technology: Surface Mount; Case/Package: TO-263; Min Operating Temperature: -40°C; Max Operating Temperature: 125°C; Packaging: Tape and Reel; Output Current: 5A; Series: SIMPLE SWITCHER®; Package Quantity: 500; Min Supply Voltage: 8V; Lead Free: Contains Lead; RoHS Compliant: Yes; ComponentLink1URL: https://datasheet.ciiva.com/6596/lm2679-6596695.pdf?src-supplier=Digi-Key; ComponentLink1Description: https://datasheet.ciiva.com/6596/lm2679-6596695.pdf?src-supplier=Digi-Key; ComponentLink2URL: https://datasheet.ciiva.com/6596/lm2679-6596699.pdf?src-supplier=Digi-Key; ComponentLink2Description: https://datasheet.ciiva.com/6596/lm2679-6596699.pdf?src-supplier=Digi-Key; ComponentLink3URL: https://datasheet.ciiva.com/6596/lm2679-6596693.pdf?src-supplier=Digi-Key; ComponentLink3Description: https://datasheet.ciiva.com/6596/lm2679-6596693.pdf?src-supplier=Digi-Key; ComponentLink4URL: https://datasheet.ciiva.com/41457/001013915-da-01-en-ic-reg-bu-lm2679sx-adj-nopb-to-263-7-tid-41457948.pdf?src-supplier=Conrad; ComponentLink4Description: https://datasheet.ciiva.com/41457/001013915-da-01-en-ic-reg-bu-lm2679sx-adj-nopb-to-263-7-tid-41457948.pdf?src-supplier=Conrad; Supplier Part Number 1: 926-LM2679SXADJNOPB; LCSC Part Number: C2877272; Item Type: IC